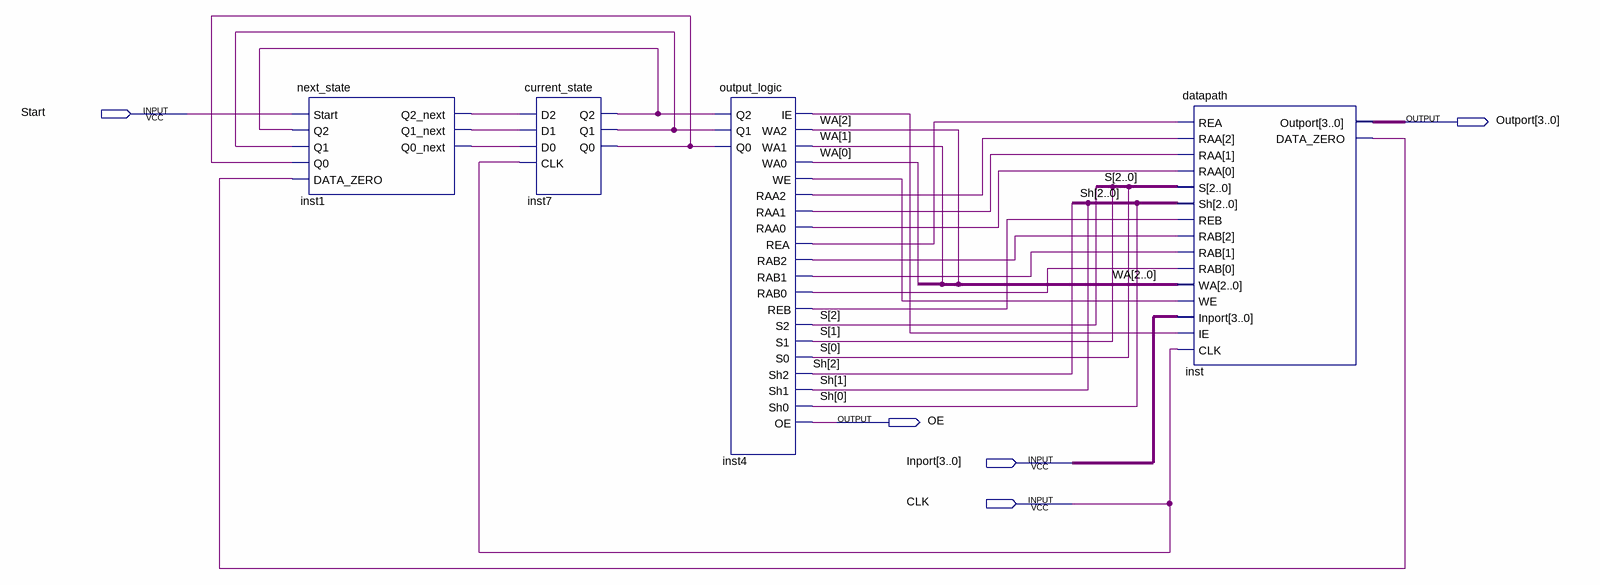
[diagram p0: schematic sheet]
// Quartus schematic Bit1Counter.bdf as structural Verilog: 4 symbols, 5 pins
module Bit1Counter (
  input  Start,
  input  [3:0] Inport,
  input  CLK,
  output [3:0] Outport,
  output OE
);

  wire inst1_q0_next, inst1_q1_next, inst1_q2_next, inst4_ie, inst4_raa0, inst4_raa1, inst4_raa2, inst4_rab0,
       inst4_rab1, inst4_rab2, inst4_rea, inst4_reb, inst4_we, inst7_q0, inst7_q1, inst7_q2, inst_data_zero;
  wire [2:0] S, Sh, WA;

  next_state inst1 (
    .Start(Start), .Q2(inst7_q2), .Q1(inst7_q1), .Q0(inst7_q0), .DATA_ZERO(inst_data_zero),
    .Q2_next(inst1_q2_next), .Q1_next(inst1_q1_next), .Q0_next(inst1_q0_next));
  current_state inst7 (
    .D2(inst1_q2_next), .D1(inst1_q1_next), .D0(inst1_q0_next), .CLK(CLK), .Q2(inst7_q2), .Q1(inst7_q1),
    .Q0(inst7_q0));
  output_logic inst4 (
    .Q2(inst7_q2), .Q1(inst7_q1), .Q0(inst7_q0), .IE(inst4_ie), .WA2(WA[2]), .WA1(WA[1]), .WA0(WA[0]),
    .WE(inst4_we), .RAA2(inst4_raa2), .RAA1(inst4_raa1), .RAA0(inst4_raa0), .REA(inst4_rea),
    .RAB2(inst4_rab2), .RAB1(inst4_rab1), .RAB0(inst4_rab0), .REB(inst4_reb), .S2(S[2]), .S1(S[1]),
    .S0(S[0]), .Sh2(Sh[2]), .Sh1(Sh[1]), .Sh0(Sh[0]), .OE(OE));
  datapath inst (
    .REA(inst4_rea), .RAA({inst4_raa2, inst4_raa1, inst4_raa0}), .S(S), .Sh(Sh), .REB(inst4_reb),
    .RAB({inst4_rab2, inst4_rab1, inst4_rab0}), .WA(WA), .WE(inst4_we), .Inport(Inport), .IE(inst4_ie),
    .CLK(CLK), .Outport(Outport), .DATA_ZERO(inst_data_zero));
endmodule
